# EasyEDA Pro project M0G3507拓展.eprj, board PCB1
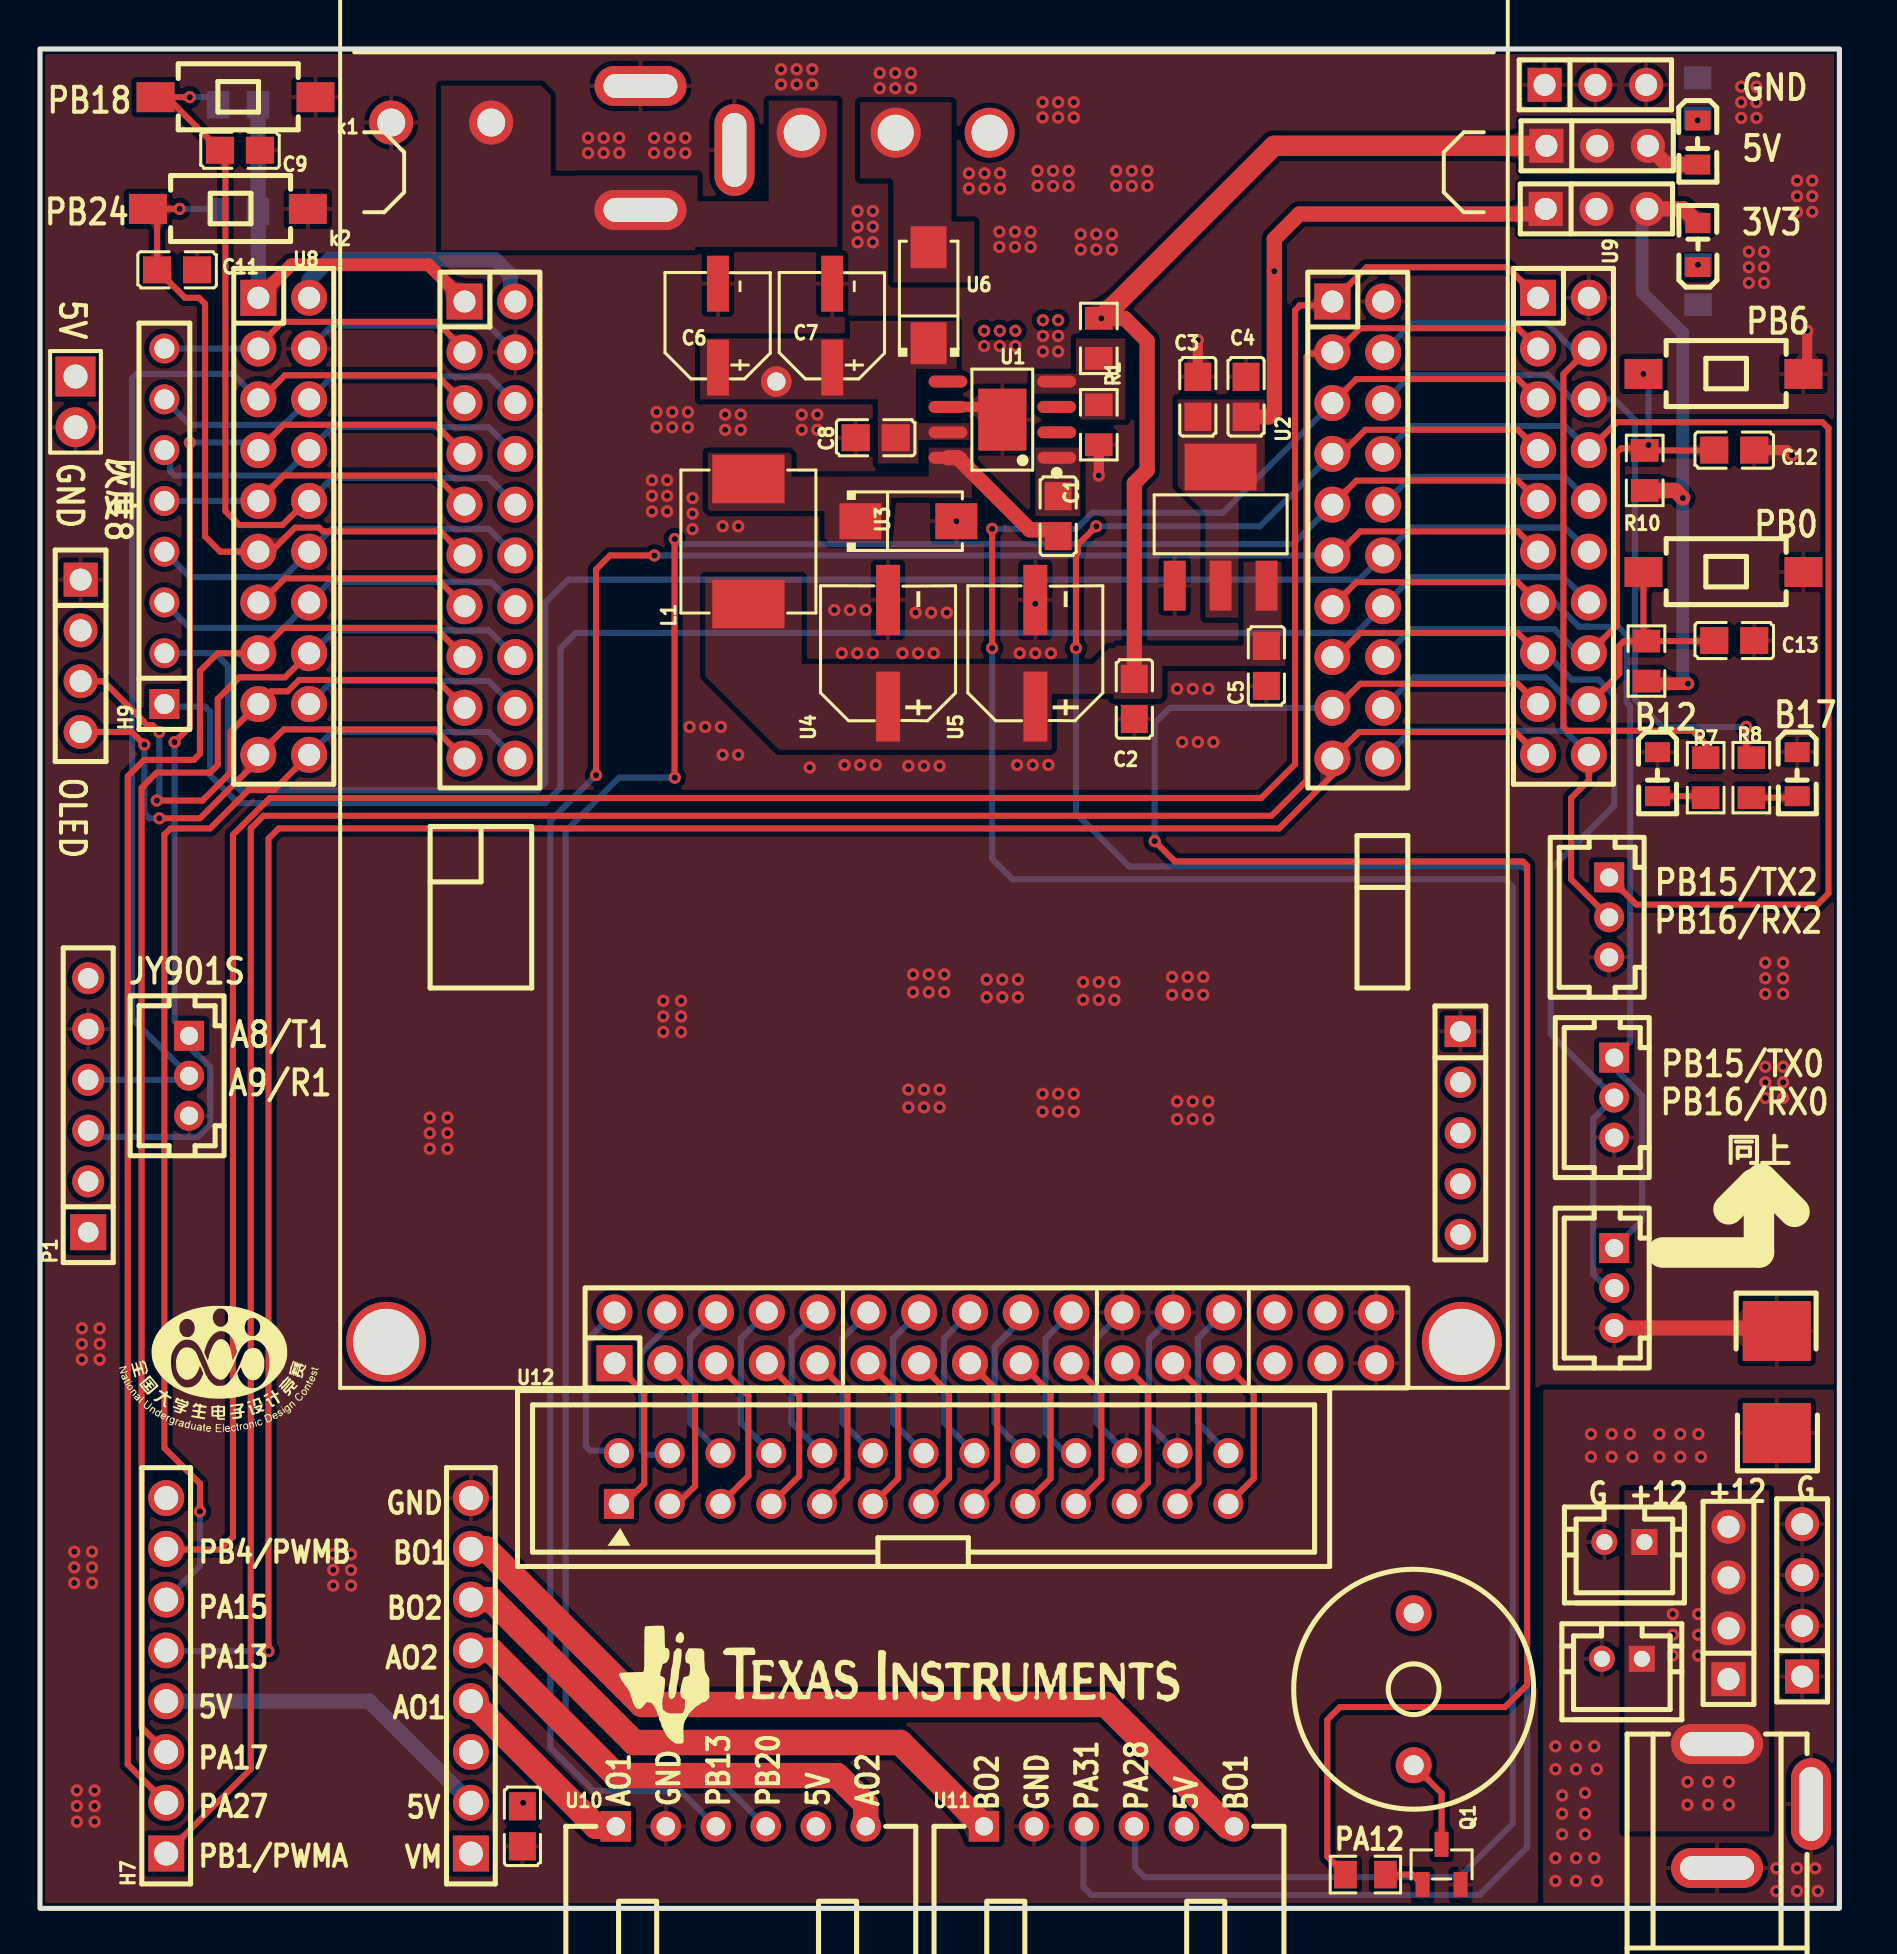
[diagram p1: board, top side]
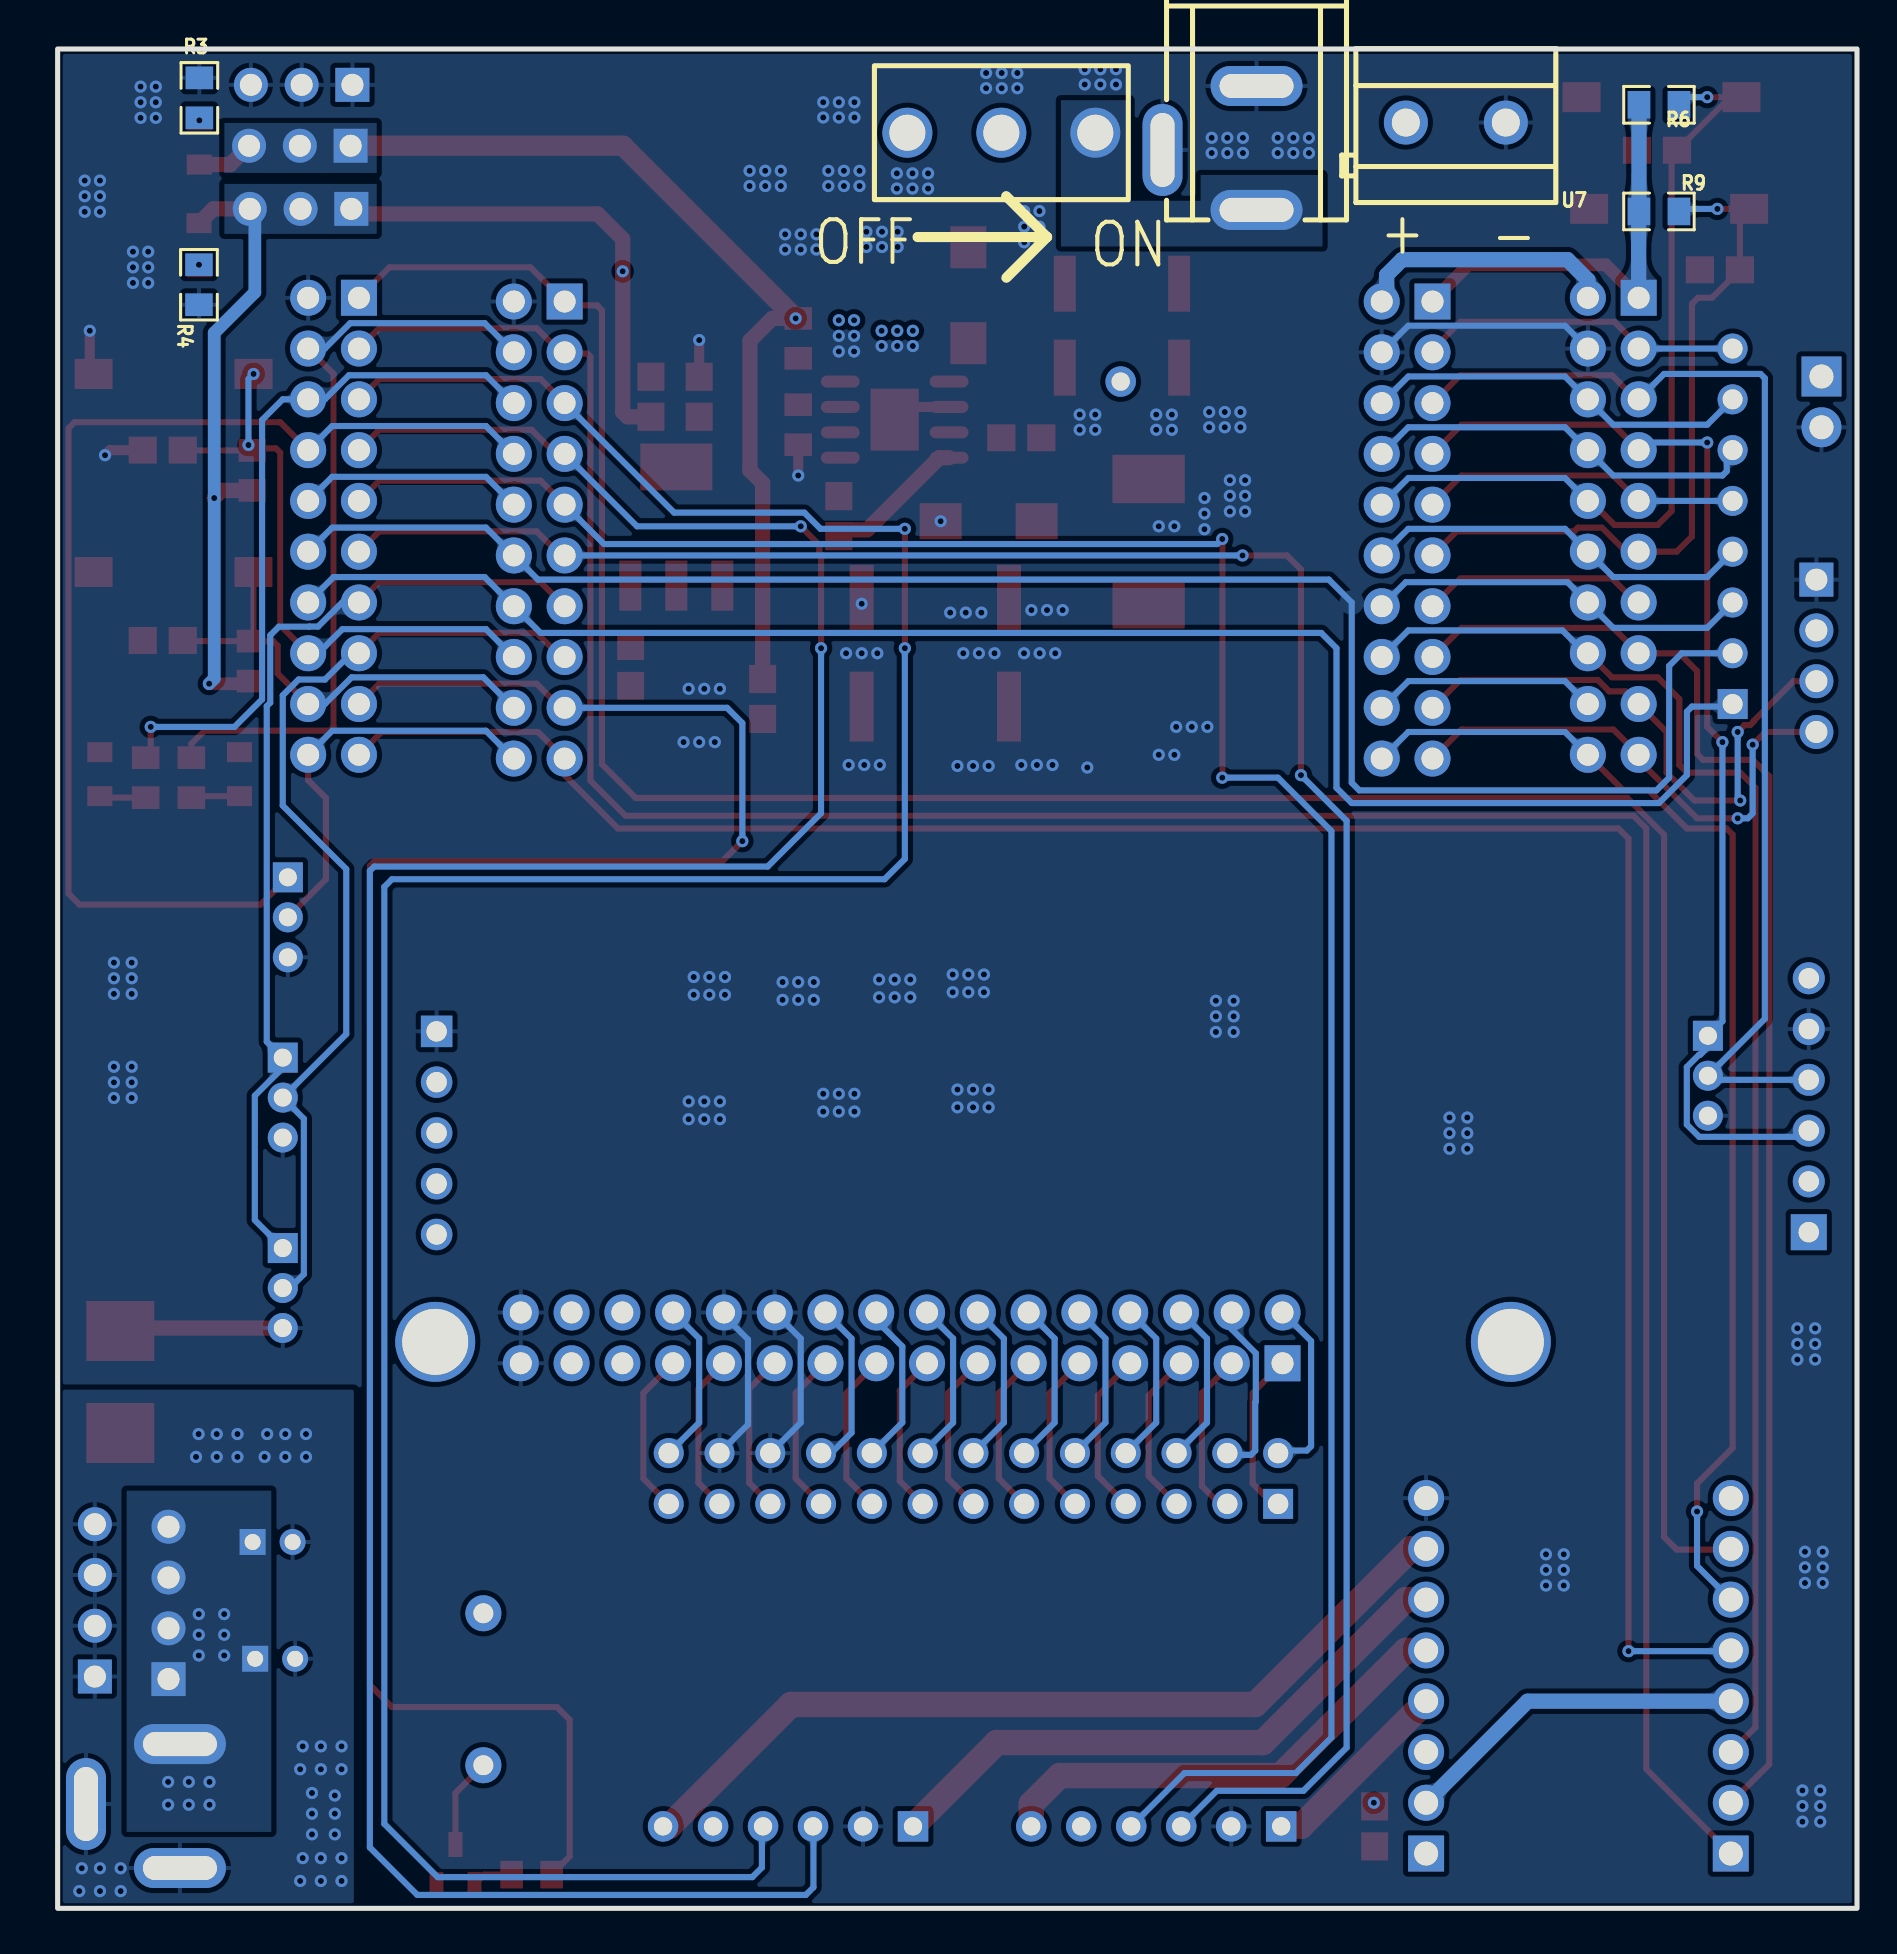
[diagram p2: board, bottom side, seen from below]

Outline 90 x 93 mm; copper layers: Top Layer, GND, 内层2, Bottom Layer. Coordinates in mm from the lower left corner of the outline.
Outline path: rectangle 0,93 90,0
Stack: Top Layer 0.035mm 外层铜厚1oz / Dielectric1 0.2104mm 7628 RC49% 8.6mil / GND 0.0152mm 内层铜厚 / Dielectric2 1.065mm 1.1mm H/HOZ Copper / 内层2 0.0152mm 内层铜厚 / Dielectric3 0.2104mm 7628 RC49% 8.6mil / Bottom Layer 0.035mm 外层铜厚1oz

## Design rules (mm)
template: JLCPCB Capability(Two Layers Board)
spacing copperThickness1oz (default): track to track 0.102, other pairs 0.152 to 0.3
spacing copperThickness2oz: track to track 0.203, other pairs 0.152 to 0.3
track width copperThickness1oz (default): min 0.127, default 0.254, max 2.54
track width copperThickness2oz: min 0.203, default 0.254, max 2.54
differential pair differentialPair (default): width min 0.127, default 0.254, max 2.54; gap min 0.152, default 0.152
via viaSize (default): diameter min 0.5, default 0.61, max 10; hole min 0.3, default 0.305, max 6.3

## Placement (name value [footprint] x y rotation side)
BUZZER1  2.3kHz  [BUZ-TH_BD12.0-P7.60-D0.6-FD]  68.71 10.96 270 top
C1  10nF  [C0805]  50.93 69.63 90 top
C2  100nF  [C0805]  54.74 60.49 90 top
C3  100nF  [C0805]  57.91 75.6 270 top
C4  10uF  [C0805]  60.32 75.6 270 top
C5  100nF  [C0805]  61.34 62.14 90 top
C6  4.7uF  [CAP-SMD_BD5.0-L5.3-W5.3-FD]  33.91 79.16 90 top
C7  4.7uF  [CAP-SMD_BD5.0-L5.3-W5.3-FD]  39.62 79.16 90 top
C8  100nF  [C0805]  41.8 73.55 180 top
C9  100nF  [C0805]  10 87.93 180 top
C10  100nF  [C0805]  24.13 4.1 270 top
C11  100nF  [C0805]  6.86 81.95 180 top
C12  100nF  [C0805]  84.74 72.93 180 top
C13  100nF  [C0805]  84.74 63.41 180 top
CN1  WAFER-PH2.0-2PZZ-H62  [CONN-TH_2P-P2.00_WAFER-PH2.0-2PZZ-H62]  79.12 12.48 180 top
CN2  WAFER-PH2.0-2PZZ-H62  [CONN-TH_2P-P2.00_WAFER-PH2.0-2PZZ-H62]  79.25 18.32 180 top
DC1  -  [DC-005_2.5]  84.2 4.99 270 top
DC1#2  -  [DC-005_2.5]  30.35 88.17 90 bottom
H1  PZ254V-11-03P  [HDR-TH_3P-P2.54-V-M]  77.8 91.2 0 top
H2  PZ254V-11-03P  [HDR-TH_3P-P2.54-V-M]  77.89 88.16 0 top
H3  PZ254V-11-03P  [HDR-TH_3P-P2.54-V-M]  77.85 85 0 top
H4  PZ254V-11-04P  [HDR-TH_4P-P2.54-V-M]  88.14 15.4 90 top
H5  PZ254V-11-04P  [HDR-TH_4P-P2.54-V-M]  84.46 15.28 90 top
H6  -  [HDR-TH_8P-P2.54-V-F-1]  21.55 11.63 90 top
H7  TB6612  [HDR-TH_8P-P2.54-V-F-1]  6.31 11.63 90 top
H8  OLED  [HDR-TH_4P-P2.54-V-F]  2.03 62.65 270 top
H9  PZ254V-11-08P  [HDR-TH_8P-P2.54-V-M]  6.22 69.12 90 top
H10  PZ254V-11-02P  [HDR-TH_2P-P2.54-V-M]  1.78 75.35 270 top
k1  TS-1101-C-W  [SW-SMD_L6.0-W3.3-LS8.0]  9.78 90.59 180 top
k2  TS-1101-C-W  [SW-SMD_L6.0-W3.3-LS8.0]  9.4 85 180 top
k3  TS-1101-C-W  [SW-SMD_L6.0-W3.3-LS8.0]  84.2 76.74 180 top
k4  TS-1101-C-W  [SW-SMD_L6.0-W3.3-LS8.0]  84.2 66.84 180 top
L1  15uH  [IND-SMD_L7.0-W6.6_FXL0630]  35.43 68.36 90 top
LED1  -  [LED_0805]  82.91 88.27 270 top
LED2  -  [LED_0805]  82.93 83.24 90 top
LED3  -  [LED_0805]  80.9 56.68 270 top
LED4  -  [LED_0805]  87.88 56.68 270 top
NOREF  -  [Pad_e2930]  36.83 76.36 0 top
P1  2.54-1*6P母  [HDR-TH_6P-P2.54-V-F]  2.41 40.17 90 top
Q1  SS8050  [SOT-23-3_L2.9-W1.3-P1.90-LS2.4-BR]  70.1 2.19 270 top
R1  3.16kΩ  [R0805]  52.96 74.2 270 top
R2  10K  [R0805]  52.96 78.52 270 top
R3  2K  [R0805]  82.91 90.55 270 bottom
R4  510  [R0805]  82.93 81.2 90 bottom
R5  0Ω  [RES-SMD_L6.4-W3.2-A]  86.87 26.32 90 top
R6  10K  [R0805]  9.91 90.21 0 bottom
R7  1K  [R0805]  83.31 56.55 90 top
R8  1K  [R0805]  85.6 56.55 90 top
R9  10K  [R0805]  9.91 84.87 0 bottom
R10  10K  [R0805]  80.26 71.92 270 top
R11  10K  [R0805]  80.35 62.38 270 top
R12  1k  [R0805]  66.29 1.69 0 top
SW1  SS-12D10L5  [SW-TH_SS-12D10L5]  42.8 88.81 0 bottom
U1  TPS5450QDDARQ1  [SOIC-8_L4.9-W3.9-P1.27-LS6.0-BL-EP]  48.13 74.46 90 top
U2  AMS1117-3.3  [SOT-223-3_L6.5-W3.4-P2.30-LS7.0-BR]  59.06 69.12 270 top
U3  SS54  [SMA_L4.2-W2.6-LS5.1-RD]  43.43 69.38 0 top
U4  100uF  [CAP-SMD_BD6.3-L6.6-W6.6-LS7.3-FD]  42.42 62.77 90 top
U5  100uF  [CAP-SMD_BD6.3-L6.6-W6.6-LS7.3-FD]  49.78 62.77 90 top
U6  SS54  [SMA_L4.2-W2.6-LS5.1-RD]  44.45 80.68 90 top
U7  KF301-5.0-2P  [CONN-TH_P5.00_KF301-5.0-2P]  20.07 89.32 0 bottom
U8  PM254-2-10-Z-8.5  [HDR-TH_20P-P2.54-V-F-R2-C10-S2.54]  12.19 69.12 270 top
U9  PM254-2-10-Z-8.5  [HDR-TH_20P-P2.54-V-F-R2-C10-S2.54]  76.2 69.12 270 top
U10  BX-XH2.54-6PWZ  [CONN-TH_6P-P2.50_BX-XH2.54-6PWZ]  35.05 4.1 0 top
U11  BX-XH2.54-6PWZ  [CONN-TH_6P-P2.50_BX-XH2.54-6PWZ]  53.47 4.1 0 top
U12  ZX-IDC2.54-2-13PZZ  [IDC-TH_26P-P2.54_ZX-IDC2.54-2-13PZZ]  44.2 21.5 0 top
U13  XY-PH2.0-3A11  [HDR-TH_3P-P2.00-V-F-4]  78.49 49.57 270 top
U14  XY-PH2.0-3A11  [HDR-TH_3P-P2.00-V-F-4]  7.46 41.64 270 top
U15  XY-PH2.0-3A11  [HDR-TH_3P-P2.00-V-F-4]  78.74 40.55 270 top
U16  XY-PH2.0-3A11  [HDR-TH_3P-P2.00-V-F-4]  78.74 31.02 270 top
U99  TL  [LP_M0G3507_L107.0_W58.5]  44.21 92.83 0 top

## Footprints (pads in the part's own frame, mm; a bottom-side part is the same pattern mirrored in y, then rotated)
BUZ-TH_BD12.0-P7.60-D0.6-FD
  round 1.8 hole 1: 1(-3.8,0) 2(3.8,0)
C0805
  rect 1.41x1.35 smd: 1(-1,0) 2(1,0)
CAP-SMD_BD5.0-L5.3-W5.3-FD
  rect 2.8x1.1 smd: 1(-2.1,0) 2(2.1,0)
CAP-SMD_BD6.3-L6.6-W6.6-LS7.3-FD
  rect 3.5x1.2 smd: 1(-2.67,0) 2(2.67,0)
CONN-TH_2P-P2.00_WAFER-PH2.0-2PZZ-H62
  rect 1.3x1.3 hole 0.8: 1(-1,0)
  round 1.3 hole 0.8: 2(1,0)
CONN-TH_6P-P2.50_BX-XH2.54-6PWZ
  rect 1.524x1.524 hole 0.914: 1(-6.25,0)
  round 1.524 hole 0.914: 2(-3.75,0) 3(-1.25,0) 4(1.25,0) 5(3.75,0) 6(6.25,0)
CONN-TH_P5.00_KF301-5.0-2P
  round 2.2 hole 1.4: 1(-2.5,0) 2(2.5,0)
DC-005_2.5
  oval 2x4.6 hole 1.2x3.7: 1(-3.227,-0.318) 2(2.973,-0.318)
  oval 4.6x2 hole 3.7x1.2: 3(-0.227,4.382)
HDR-TH_2P-P2.54-V-M
  rect 2x2 hole 1.2: 1(-1.27,0)
  round 2 hole 1.2: 2(1.27,0)
HDR-TH_3P-P2.00-V-F-4
  rect 1.5x1.5 hole 0.9: 1(-2,0)
  round 1.5 hole 0.9: 2(0,0) 3(2,0)
HDR-TH_3P-P2.54-V-M
  rect 1.7x1.7 hole 1.1: 1(-2.54,0)
  round 1.7 hole 1.1: 2(0,0) 3(2.54,0)
HDR-TH_4P-P2.54-V-F
  rect 1.7x1.7 hole 1.1: 1(-3.81,0)
  round 1.7 hole 1.1: 2(-1.27,0) 3(1.27,0) 4(3.81,0)
HDR-TH_4P-P2.54-V-M
  rect 1.7x1.7 hole 1.1: 1(-3.81,0)
  round 1.7 hole 1.1: 2(-1.27,0) 3(1.27,0) 4(3.81,0)
HDR-TH_6P-P2.54-V-F
  rect 1.8x1.8 hole 1.02: 1(-6.35,0)
  round 1.6 hole 1.02: 2(-3.81,0) 3(-1.27,0) 4(1.27,0) 5(3.81,0) 6(6.35,0)
HDR-TH_8P-P2.54-V-F-1
  rect 1.8x1.8 hole 1.2: 1(-8.89,0)
  round 1.8 hole 1.2: 2(-6.35,0) 3(-3.81,0) 4(-1.27,0) 5(1.27,0) 6(3.81,0) 7(6.35,0) 8(8.89,0)
HDR-TH_8P-P2.54-V-M
  rect 1.5x1.5 hole 1: 1(-8.89,0)
  round 1.5 hole 1: 2(-6.35,0) 3(-3.81,0) 4(-1.27,0) 5(1.27,0) 6(3.81,0) 7(6.35,0) 8(8.89,0)
HDR-TH_20P-P2.54-V-F-R2-C10-S2.54
  rect 1.8x1.8 hole 1.1: 1(-11.43,-1.27)
  round 1.8 hole 1.1: 2(-11.43,1.27) 3(-8.89,-1.27) 4(-8.89,1.27) 5(-6.35,-1.27) 6(-6.35,1.27) 7(-3.81,-1.27) 8(-3.81,1.27) 9(-1.27,-1.27) 10(-1.27,1.27) 11(1.27,-1.27) 12(1.27,1.27) 13(3.81,-1.27) 14(3.81,1.27) 15(6.35,-1.27) 16(6.35,1.27) 17(8.89,-1.27) 18(8.89,1.27) 19(11.43,-1.27) 20(11.43,1.27)
IDC-TH_26P-P2.54_ZX-IDC2.54-2-13PZZ
  rect 1.5x1.5 hole 1.02: 1(-15.24,-1.27)
  round 1.5 hole 1.02: 2(-15.24,1.27) 3(-12.7,-1.27) 4(-12.7,1.27) 5(-10.16,-1.27) 6(-10.16,1.27) 7(-7.62,-1.27) 8(-7.62,1.27) 9(-5.08,-1.27) 10(-5.08,1.27) 11(-2.54,-1.27) 12(-2.54,1.27) 13(0,-1.27) 14(0,1.27) 15(2.54,-1.27) 16(2.54,1.27) 17(5.08,-1.27) 18(5.08,1.27) 19(7.62,-1.27) 20(7.62,1.27) 21(10.16,-1.27) 22(10.16,1.27) 23(12.7,-1.27) 24(12.7,1.27) 25(15.24,-1.27) 26(15.24,1.27)
IND-SMD_L7.0-W6.6_FXL0630
  rect 2.424x3.62 smd: 1(3.128,0) 2(-3.128,0)
LED_0805
  rect 1x1.25 smd: 1(-1.15,0.005) 2(1.05,0.005)
LP_M0G3507_L107.0_W58.5
  rect 1.8x1.8 hole 1.1: 1(-22.981,-12.466) 21(20.428,-12.466) 41(-15.48,-65.57)
  round 1.8 hole 1.1: 2(-22.981,-15.007) 3(-22.981,-17.547) 4(-22.981,-20.087) 5(-22.981,-22.627) 6(-22.981,-25.166) 7(-22.981,-27.706) 8(-22.981,-30.247) 9(-22.981,-32.786) 10(-22.981,-35.327) 11(-20.441,-35.327) 12(-20.441,-32.786) 13(-20.441,-30.247) 14(-20.441,-27.706) 15(-20.441,-25.166) 16(-20.441,-22.627) 17(-20.441,-20.087) 18(-20.441,-17.547) 19(-20.441,-15.007) 20(-20.441,-12.466) 22(20.428,-15.007) 23(20.428,-17.547) 24(20.428,-20.087) 25(20.428,-22.627) 26(20.428,-25.166) 27(20.428,-27.706) 28(20.428,-30.247) 29(20.428,-32.786) 30(20.428,-35.327) 31(22.968,-35.327) 32(22.968,-32.786) 33(22.968,-30.247) 34(22.968,-27.706) 35(22.968,-25.166) 36(22.968,-22.627) 37(22.968,-20.087) 38(22.968,-17.547) 39(22.968,-15.007) 40(22.968,-12.466) 42(-12.94,-65.57) 43(-10.4,-65.57) 44(-7.86,-65.57) 45(-5.32,-65.57) 46(-5.32,-63.03) 47(-7.86,-63.03) 48(-10.4,-63.03) 49(-12.94,-63.03) 50(-15.48,-63.03) 51(-2.78,-65.57) 52(-0.24,-65.57) 53(2.3,-65.57) 54(4.84,-65.57) 55(7.38,-65.57) 56(7.38,-63.03) 57(4.84,-63.03) 58(2.3,-63.03) 59(-0.24,-63.03) 60(-2.78,-63.03) 61(9.92,-65.57) 62(12.46,-65.57) 63(15,-65.57) 64(15,-63.03) 65(12.46,-63.03) 66(9.92,-63.03) 67(17.54,-65.57) 68(20.08,-65.57) 69(22.62,-65.57) 70(22.62,-63.03) 71(20.08,-63.03) 72(17.54,-63.03)
  rect 1.575x1.575 hole 1.02: 73(26.83,-48.97)
  round 1.575 hole 1.02: 74(26.83,-51.51) 75(26.83,-54.05) 76(26.83,-56.59) 77(26.83,-59.13)
  round 4 hole 3.3: 78(-26.9,-64.5) 79(26.9,-64.5)
Pad_e2930
  round 1.524 hole 0.914: 1(0,0)
R0805
  rect 1.133x1.377 smd: 1(-1,0) 2(1,0)
RES-SMD_L6.4-W3.2-A
  rect 3x3.4 smd: 1(-2.55,0) 2(2.55,0)
SMA_L4.2-W2.6-LS5.1-RD
  rect 2.1x1.8 smd: 1(-2.4,0) 2(2.4,0)
SOIC-8_L4.9-W3.9-P1.27-LS6.0-BL-EP
  oval 0.602x1.941 smd: 1(-1.905,-2.72) 2(-0.635,-2.72) 3(0.635,-2.72) 4(1.905,-2.72) 5(1.905,2.72) 6(0.635,2.72) 7(-0.635,2.72) 8(-1.905,2.72)
  rect 3.098x2.41 smd: 9(0,0)
SOT-23-3_L2.9-W1.3-P1.90-LS2.4-BR
  rect 1.25x0.7 smd: 1(1,-0.95) 2(1,0.95) 3(-1,0)
SOT-223-3_L6.5-W3.4-P2.30-LS7.0-BR
  rect 2.5x1.1 smd: 1(2.97,-2.3) 2(2.97,0) 3(2.97,2.3)
  rect 2.34x3.6 smd: 4(-2.97,0)
SW-SMD_L6.0-W3.3-LS8.0
  rect 1.9x1.5 smd: 1(-4,0) 2(4,0)
SW-TH_SS-12D10L5
  round 2.5 hole 1.8: 1(-4.7,0) 2(0,0) 3(4.7,0)

## Nets
3V3: C3.2 C4.2 H3.1 H3.2 H3.3 H8.2 LED2.2 P1.2 R6.2 R9.2 R10.2 R11.2 U2.2 U2.4 U8.1 U99.1 U99.68 U99.71
5V: BUZZER1.1 C2.2 C5.2 C10.1 H2.1 H2.2 H2.3 H6.2 H7.4 H10.1 L1.2 LED1.2 R2.1 U2.3 U4.1 U5.1 U8.2 U10.5 U11.5 U99.20 U99.67 U99.72
12V: DC1#2.1 SW1.1 U7.2
12V_BAT: CN1.1 CN2.1 DC1.1 H5.1 H5.2 H5.3 H5.4
+12V: SW1.2 U6.2
GND: C2.1 C3.1 C4.1 C5.1 C6.2 C7.2 C8.2 C9.1 C10.2 C11.1 C12.1 C13.1 DC1#2.2 DC1#2.3 H1.1 H1.2 H1.3 H6.8 H8.1 H10.2 k1.1 k2.1 k3.1 k4.1 LED3.1 LED4.1 P1.5 Q1.2 R1.2 R3.1 R4.1 R5.2 U1.6 U1.9 U2.1 U3.2 U4.2 U5.2 U7.1 U8.4 U9.2 U10.2 U11.2 U12.22 U12.24 U13.3 U14.3 U15.3 U16.3 U99.19 U99.40 U99.65 U99.66 U99.69 U99.70 U99.73
GND_BAT: CN1.2 CN2.2 DC1.2 DC1.3 H4.1 H4.2 H4.3 H4.4 R5.1
A12: U12.21 U99.61
A13: U12.23 U99.62
AO1: H6.4 U10.1
AO2: H6.5 U10.6
BO1: H6.7 U11.6
BO2: H6.6 U11.1
EC11_A: U99.76
EC11_B: U99.77
EC11_K: U99.75
NRST: U9.10 U99.36
PA0: U12.2 U99.50
PA1: U12.12 U99.60
PA2: U12.20 U99.56
PA3: U12.19 U99.55
PA4: U12.18 U99.57
PA5: U12.17 U99.54
PA6: U12.16 U99.58
PA7: U12.15 U99.53
PA8/T1: P1.3 U8.7 U14.1 U99.4
PA9/R1: P1.4 U8.5 U14.2 U99.3
PA10: U12.25 U99.63
PA10/T0: U9.13 U15.1 U16.1 U99.27
PA11: U12.26 U99.64
PA11/R0: U9.15 U15.2 U16.2 U99.28
PA12: R12.1 U9.17 U99.29
PA13: H7.5 U9.19 U99.30
PA14: U12.14 U99.59
PA15: H7.6 U8.20 U99.11
PA17: H7.3 U8.16 U99.13
PA18: H9.4 U8.12 U99.15
PA21: U12.13 U99.52
PA22: H9.6 U8.8 U99.17
PA23: U12.11 U99.51
PA24: H9.3 U8.14 U99.14
PA25: H9.8 U8.3 U99.2
PA26: H9.5 U8.9 U99.5
PA27: H7.2 U8.15 U99.8
PA28: U9.5 U11.4 U99.23
PA31: U9.7 U11.3 U99.24
PB0: C13.2 k4.2 R11.1 U9.18 U99.32
PB1_PWMA: H7.1 U9.3 U99.22
PB2_SCL1: H8.3 U8.17 U99.9
PB3_SDA1: H8.4 U8.19 U99.10
PB4_PWMB: H7.7 U9.1 U99.21
PB5: U12.10 U99.46
PB6: C12.2 k3.2 R10.1 U9.16 U99.33
PB7: H9.1 U9.14 U99.34
PB8: H9.2 U9.12 U99.35
PB9: U8.13 U99.7
PB10: U12.9 U99.45
PB11: U12.8 U99.47
PB12: R7.2 U9.4 U99.39
PB13: U9.11 U10.3 U99.26
PB15/T2: U9.8 U13.1 U99.37
PB16/R2: U9.20 U13.2 U99.31
PB17: R8.2 U9.6 U99.38
PB18: C9.2 k1.2 R6.1 U8.10 U99.16
PB19: H9.7 U8.6 U99.18
PB20: U9.9 U10.4 U99.25
PB21: U12.7 U99.44
PB22: U12.6 U99.48
PB23: U12.5 U99.43
PB24: C11.2 k2.2 R9.1 U8.11 U99.6
PB25: U12.4 U99.49
PB26: U12.3 U99.42
PB27: U12.1 U99.41
SW2: U8.18 U99.12
$1N2343: C6.1 C7.1 C8.1 H6.1 NOREF.1 U1.7 U6.1
$1N2346: C1.1 L1.1 U1.8 U3.1
$1N2347: C1.2 U1.1
$1N2351: R1.1 R2.2 U1.4
$1N2353: LED1.1 R3.2
$1N2356: LED2.1 R4.2
$1N4593: LED3.2 R7.1
$1N4596: LED4.2 R8.1
$1N4743: Q1.1 R12.2
$1N4744: BUZZER1.2 Q1.3
$1N34298: U99.74

Pads without a net: H6 3; H7 8; P1 1 6; SW1 3; U1 2 3 5; U99 78 79

## Via types
v1: diameter 0.61, hole 0.305, Top Layer to Bottom Layer, 330 vias

## Routing (per net, layer and track width the routed paths; a pad name or vN(x,y) marks a point on that pad's centre or on a via; arc(x,y) is an arc through that point)
3V3: length 228.6
  Top Layer w0.635: R11.2 80.49,61.25 v1(82.42,61.25) ; U8.1 12.57,82.2 19.43,82.2 21.23,80.4 U99.1
  Top Layer w0.762: R10.2 81.79,70.92 v1(82.17,70.54) ; H3.1 75.06,84.75 62.99,84.75 61.74,83.49 v1(61.74,81.88) 61.74,74.84 61.5,74.6 C4.2 ; 82.93,84.29 82.21,85 H3.3
  内层2 w0.762: U99.1 22.75,81.88 v1(61.74,81.88) ; P1.2 3.75,37.69 3.75,47.07 3.56,47.26 3.56,62.27 2.03,63.79 H8.2 4.32,66.2 4.32,80.3 4.57,80.55 U8.1 ; U99.71 U99.68 64.29,25.4 64.64,25.06 79.25,25.06 82.42,28.23 v1(82.42,61.25)
  Bottom Layer w0.635: H3.3 80.14,84.75 80.14,80.83 82.17,78.79 v1(82.17,70.54) 82.17,61.5 v1(82.42,61.25)
  Bottom Layer w0.762: U8.1 10.92,84.86 R9.2 R6.2
5V: length 256.7
  Top Layer w0.762: C2.2 54.74,71.28 55.37,71.92 55.37,78.4 54.25,79.52 v1(53.09,79.52) ; LED1.2 81.37,87.22 H2.3
  Top Layer w1.016: v1(53.09,79.52) 61.72,88.16 H2.1
  内层2 w0.762: U8.2 12.36,81.66 12.36,81.67 12.04,81.99 12.03,81.99 10.67,83.35 2.41,83.35 2.1,83.03 2.1,76.93 H10.1 ; H6.2 v1(24.17,5.28) 24.89,6 36.9,6 U10.5 41.09,1.81 56.77,1.81 57.31,2.35 57.31,3.81 57.28,3.85 ; U99.20 24.62,79.52 v1(53.09,79.52) 53.85,78.76 53.85,58.08 63.12,48.8 63.12,30.65 62.86,30.4 62.86,29.89 62.52,29.55 62.01,29.55 U99.72 U99.67 62.94,26.08 62.94,24.85 68.71,19.09 BUZZER1.1 59.34,5.4 59.18,5.4 58.42,4.64 58.42,4.47 58.05,4.1 U11.5
  Bottom Layer w0.762: H6.2 16.47,10.36 H7.4 ; U8.2 13.46,81.44 14.48,82.46 22.76,82.46 23.53,81.69 23.53,80.61 U99.20
  vias: v1(47.22,78.9) v1(48.01,78.9) v1(48.79,78.9) v1(50.16,79.43) v1(50.93,79.43)
12V_BAT:
  vias: v1(81.67,14.72) v1(81.67,13.68) v1(81.67,12.65) v1(82.4,6.32) v1(82.4,5.18) v1(82.94,14.72) v1(82.94,13.68) v1(82.94,12.65) v1(83.44,6.32) v1(83.44,5.18) v1(84.47,6.32) v1(84.47,5.18)
GND: length 45.7
  Top Layer w0.508: C12.1 87.38,72.93 v1(87.63,72.68) ; v1(88.39,78.9) 88.39,76.94 k3.1 ; C3.1 v1(57.91,78.44) ; U1.6 47.5,75.09 47.63,74.96 ; R1.2 v1(52.96,71.66)
  Top Layer w0.762: U16.3 86.72,29.02 86.87,28.88
  Bottom Layer w0.305: U99.66 52.83,28.5 52.83,24.29 U12.22 ; U12.24 55.47,24.19 55.47,28.45 56.67,29.66 U99.65 ; U8.4 14.61,79.16 22.44,79.16 U99.19
  vias: v1(1.71,17.84) v1(1.71,17.05) v1(1.71,16.27) v1(1.84,5.9) v1(1.84,5.12) v1(1.84,4.34) v1(2.1,29.01) v1(2.1,28.23) v1(2.1,27.45) v1(2.6,17.84) v1(2.6,17.05) v1(2.6,16.27) v1(2.73,5.9) v1(2.73,5.12) v1(2.73,4.34) v1(2.98,29.01) v1(2.98,28.23) v1(2.98,27.45) v1(14.67,17.71) v1(14.67,16.93) v1(14.67,16.15) v1(15.56,17.71) v1(15.56,16.93) v1(15.56,16.15) v1(19.49,39.55) v1(19.49,38.77) v1(19.49,37.99) v1(20.38,39.55) v1(20.38,38.77) v1(20.38,37.99) v1(27.41,88.56) v1(27.41,87.79) v1(28.19,88.56) v1(28.19,87.79) v1(28.97,88.56) v1(28.97,87.79) v1(30.61,71.43) v1(30.61,70.65) v1(30.61,69.87) v1(30.72,88.56) v1(30.72,87.79) v1(30.84,74.84) v1(30.84,74.08) v1(31.18,45.39) v1(31.18,44.61) v1(31.18,43.83) v1(31.37,71.43) v1(31.37,70.65) v1(31.37,69.87) v1(31.5,88.56) v1(31.5,87.79) v1(31.62,74.84) v1(31.62,74.08) v1(32.07,45.39) v1(32.07,44.61) v1(32.07,43.83) v1(32.28,88.56) v1(32.28,87.79) v1(32.4,74.84) v1(32.4,74.08) v1(32.49,59.09) v1(32.64,70.54) v1(32.64,69.76) v1(32.64,68.98) v1(33.27,59.09) v1(34.14,69.12) v1(34.06,59.09) v1(34.14,57.69) v1(34.27,74.71) v1(34.27,73.95) v1(34.93,69.12) v1(34.93,57.69) v1(35.05,74.71) v1(35.05,73.95) v1(37.06,91.98) v1(37.06,91.22) v1(37.85,91.98) v1(37.85,91.22) v1(38.1,74.71) v1(38.1,73.95) v1(38.5,57.06) v1(38.63,91.98) v1(38.63,91.22) v1(38.88,74.71) v1(38.88,73.95) v1(39.73,64.93) v1(40.1,62.77) v1(40.24,57.19) v1(40.51,64.93) v1(40.89,84.89) v1(40.89,84.11) v1(40.89,83.33) v1(40.88,62.77) v1(41.02,57.19) v1(41.29,64.93) v1(41.66,84.89) v1(41.66,84.11) v1(41.66,83.33) v1(41.66,62.77) v1(41.8,57.19) v1(42,91.8) v1(42,91.03) v1(42.78,91.8) v1(42.78,91.03) v1(43.14,62.77) v1(43.43,57.14) v1(43.43,40.95) v1(43.43,40.06) v1(43.56,91.8) v1(43.56,91.03) v1(43.67,46.71) v1(43.67,45.82) v1(43.8,64.81) v1(43.92,62.77) v1(44.21,57.14) v1(44.21,40.95) v1(44.21,40.06) v1(44.45,46.71) v1(44.45,45.82) v1(44.58,64.81) v1(44.7,62.77) v1(45,57.14) v1(45,40.95) v1(45,40.06) v1(45.23,46.71) v1(45.23,45.82) v1(45.36,64.81) v1(45.83,69.38) v1(46.46,86.78) v1(46.46,86.02) v1(47.24,86.78) v1(47.24,86.02) v1(47.22,78.14) v1(47.35,46.45) v1(47.35,45.57) v1(48.03,86.78) v1(48.03,86.02) v1(47.99,83.86) v1(47.99,83.09) v1(48.01,78.14) v1(48.13,46.45) v1(48.13,45.57) v1(48.77,83.86) v1(48.77,83.09) v1(48.79,78.14) v1(48.88,57.19) v1(48.91,46.45) v1(48.91,45.57) v1(49,62.77) v1(49.55,83.86) v1(49.55,83.09) v1(49.66,57.19) v1(49.78,65.25) v1(49.78,62.77) v1(49.89,86.9) v1(49.89,86.14) v1(50.15,90.33) v1(50.15,89.57) v1(50.15,40.74) v1(50.15,39.85) v1(50.16,78.65) v1(50.16,77.87) v1(50.44,57.19) v1(50.56,62.77) v1(50.67,86.9) v1(50.67,86.14) v1(50.93,90.33) v1(50.93,89.57) v1(50.93,78.65) v1(50.93,77.87) v1(50.93,40.74) v1(50.93,39.85) v1(51.45,86.9) v1(51.45,86.14) v1(51.71,90.33) v1(51.71,89.57) v1(51.71,40.74) v1(51.71,39.85) v1(52.05,83.73) v1(52.05,82.97) v1(52.18,46.33) v1(52.18,45.44) v1(52.83,83.73) v1(52.83,82.97) v1(52.96,46.33) v1(52.96,45.44) v1(53.61,83.73) v1(53.61,82.97) v1(53.74,46.33) v1(53.74,45.44) v1(53.83,86.9) v1(53.83,86.14) v1(54.61,86.9) v1(54.61,86.14) v1(55.39,86.9) v1(55.39,86.14) v1(56.62,46.58) v1(56.62,45.69) v1(56.88,61) v1(56.88,40.36) v1(56.88,39.47) v1(57.13,58.33) v1(57.4,46.58) v1(57.4,45.69) v1(57.66,61) v1(57.66,40.36) v1(57.66,39.47) v1(57.91,58.33) v1(58.19,46.58) v1(58.19,45.69) v1(58.44,61) v1(58.44,40.36) v1(58.44,39.47) v1(58.69,58.33) v1(85.09,91.11) v1(85.09,90.33) v1(85.09,89.55) v1(85.47,82.86) v1(85.47,82.08) v1(85.47,81.3) v1(85.85,91.11) v1(85.85,90.33) v1(85.85,89.55) v1(86.23,82.86) v1(86.23,82.08) v1(86.23,81.3) v1(86.3,47.3) v1(86.3,46.52) v1(86.3,45.74) v1(86.3,42.09) v1(86.3,41.31) v1(86.3,40.53) v1(87.19,47.3) v1(87.19,46.52) v1(87.19,45.74) v1(87.19,42.09) v1(87.19,41.31) v1(87.19,40.53) v1(87.88,86.42) v1(87.88,85.63) v1(87.88,84.85) v1(88.65,86.42) v1(88.65,85.63) v1(88.65,84.85)
GND_BAT:
  vias: v1(75.8,8.1) v1(75.8,6.96) v1(75.8,2.51) v1(75.8,1.37) v1(76.14,5.64) v1(76.14,4.74) v1(76.14,3.7) v1(76.84,8.1) v1(76.84,6.96) v1(76.84,2.51) v1(76.84,1.37) v1(77.28,5.77) v1(77.28,4.74) v1(77.28,3.7) v1(77.58,23.72) v1(77.58,22.58) v1(77.74,8.1) v1(77.74,2.51) v1(77.87,6.96) v1(77.87,1.37) v1(78.61,23.72) v1(78.61,22.58) v1(79.52,23.72) v1(79.65,22.58) v1(81.01,23.72) v1(81.01,22.58) v1(82.04,23.72) v1(82.04,22.58) v1(82.95,23.72) v1(83.08,22.58) v1(86.85,2) v1(86.85,0.86) v1(87.88,2) v1(87.88,0.86) v1(88.79,2) v1(88.92,0.86)
A12: length 8
  Top Layer w0.305: U12.21 55.41,21.28 55.41,25.99 U99.61
A13: length 8
  Top Layer w0.305: U12.23 57.95,21.28 57.95,25.99 U99.62
AO1: length 9.8
  Top Layer w1.27: H6.4 27.81,4.1 U10.1
AO2: length 24
  Top Layer w1.27: H6.5 22.57,12.9 28.83,6.64 39.88,6.64 41.3,5.22 U10.6
BO1: length 43.9
  Top Layer w1.27: H6.7 22.31,17.98 30.1,10.2 53.31,10.2 59.41,4.1 U11.6
BO2: length 30.4
  Top Layer w1.27: H6.6 22.57,15.44 29.72,8.29 43.03,8.29 U11.1
NRST: length 11.4
  Bottom Layer w0.305: U99.36 68.58,71.6 76.27,71.6 U9.10
PA0: length 9.1
  Bottom Layer w0.305: U12.2 28.83,22.9 27.52,22.9 27.31,23.11 27.31,28.37 U99.50
PA1: length 8.2
  Bottom Layer w0.305: U99.60 40.13,28.5 40.13,24.29 U12.12
PA2: length 8.5
  Bottom Layer w0.305: U99.56 50.29,28.5 50.29,23.78 51.31,22.77 U12.20
PA3: length 8.2
  Top Layer w0.305: U99.55 53.09,25.77 53.09,21.5 U12.19
PA4: length 8.2
  Bottom Layer w0.305: U99.57 49.05,29.41 47.75,28.1 47.75,24.29 U12.18
PA5: length 8.2
  Top Layer w0.305: U12.17 50.55,21.5 50.55,25.77 U99.54
PA6: length 8.2
  Bottom Layer w0.305: U12.16 45.21,24.29 45.21,28.5 U99.58
PA7: length 8.1
  Top Layer w0.305: U99.53 47.88,25.9 47.88,21.37 U12.15
PA8/T1: length 56.7
  Top Layer w0.305: U99.4 19.78,74.2 12.19,74.2 U8.7 ; v1(7.49,73.31) 7.49,59.09 v1(6.73,58.33)
  Bottom Layer w0.305: v1(7.49,73.31) 10.54,73.31 U8.7 ; P1.3 2.72,38.59 7.89,38.59 8.51,39.21 8.51,42.08 7.89,42.7 7.84,42.7 7.46,43.08 U14.1 6.73,44.37 v1(6.73,58.33)
PA9/R1: length 59.5
  Top Layer w0.305: U99.3 19.84,76.68 12.25,76.68 11.05,75.47 U8.5
  Bottom Layer w0.305: P1.4 7.25,41.44 U14.2 4.61,44.49 4.61,76.53 4.83,76.74 9.65,76.74 U8.5
PA10: length 8.2
  Top Layer w0.305: U12.25 60.71,21.5 60.71,25.77 U99.63
PA10/T0: length 48.5
  Top Layer w0.305: U9.13 73.91,66.33 65.85,66.33 U99.27
  Bottom Layer w0.305: U16.1 80.14,34.42 80.14,40.64 78.74,42.04 U15.1 79.54,43.35 79.54,60.13 79.37,60.3 79.37,63.67 78.94,64.1 77.41,64.1 77.4,64.11 76.97,64.11 75.77,65.31 U9.13
PA11: length 8.2
  Bottom Layer w0.305: U12.26 57.91,24.29 57.91,28.5 U99.64
PA11/R0: length 49.4
  Top Layer w0.305: U99.28 64.84,62.59 66.04,63.79 73.91,63.79 U9.15
  Bottom Layer w0.305: U16.2 78.74,30.93 78.48,30.93 77.69,31.72 77.69,39.49 U15.2 75.56,43.72 75.56,51.98 78.74,55.15 78.74,60.67 77.95,61.46 76.63,61.46 75.31,62.77 U9.15
PA12: length 105.3
  Top Layer w0.305: R12.1 64.39,2.59 64.39,9.43 65.02,10.07 73.28,10.07 74.38,11.17 74.38,52.14 74.17,52.36 56.77,52.36 v1(55.75,53.38) ; U99.29 64.84,60.05 66.04,61.25 73.91,61.25 U9.17
  Bottom Layer w0.305: U99.29 56.51,60.05 55.75,59.28 v1(55.75,53.38)
PA13: length 112.4
  Top Layer w0.305: U9.19 73.79,58.84 65.97,58.84 U99.30 64.64,56.68 61.98,54.01 11.94,54.01 11.43,53.5 v1(11.43,12.86)
  Bottom Layer w0.305: H7.5 6.35,12.86 v1(11.43,12.86)
PA14: length 8.2
  Bottom Layer w0.305: U12.14 42.67,24.29 42.67,28.5 U99.59
PA15: length 59.9
  Top Layer w0.305: v1(8,19.85) 8,21.25 6.22,23.02 6.22,53.71 6.53,54.01 8.51,54.01 10.44,55.94 11.71,55.94 U8.20
  Bottom Layer w0.305: U99.11 22.44,58.84 14.61,58.84 U8.20 ; v1(8,19.85) 8,17.13 H7.6
PA17: length 73.2
  Top Layer w0.305: H7.3 5.08,9.05 5.08,56.04 5.84,56.81 8.51,56.81 8.89,57.19 8.89,60.49 9.97,61.57 12.26,61.57 U8.16
  Bottom Layer w0.305: U8.16 13.59,62.77 14.73,63.92 22.44,63.92 U99.13
PA18: length 19.6
  Bottom Layer w0.305: H9.4 7.49,66.58 12.19,66.58 U8.12 14.61,69 22.44,69 U99.15
PA21: length 8.2
  Top Layer w0.305: U99.52 45.47,25.77 45.47,21.5 U12.13
PA22: length 20.1
  Bottom Layer w0.305: U99.17 22.44,74.08 14.61,74.08 U8.8 12.19,71.66 6.73,71.66 6.52,71.88 6.52,72.64 H9.6
PA23: length 8.2
  Top Layer w0.305: U99.51 42.93,25.77 42.93,21.5 U12.11
PA24: length 19.5
  Bottom Layer w0.305: U99.14 22.57,66.33 14.48,66.33 U8.14 12.19,64.04 7.49,64.04 H9.3
PA25: length 16.3
  Top Layer w0.305: U8.3 10.92,78.14 12.13,79.35 19.84,79.35 21.23,77.95 U99.2
  Bottom Layer w0.305: U8.3 H9.8
PA26: length 16.1
  Top Layer w0.305: U8.9 12.19,71.66 19.78,71.66 U99.5
  Bottom Layer w0.305: U8.9 H9.5
PA27: length 75.1
  Top Layer w0.305: U99.8 19.78,64.04 12.19,64.04 U8.15 8.89,62.77 8,61.89 8,57.75 7.7,57.44 5.21,57.44 4.39,56.62 4.39,7.2 H7.2
PA28: length 143.1
  Top Layer w0.305: U99.23 65.85,76.49 73.91,76.49 U9.5 ; v1(47.62,69) v1(47.62,63.03)
  Bottom Layer w0.305: v1(47.62,63.03) 47.62,52.49 48.64,51.47 73.28,51.47 73.66,51.09 73.66,4.23 70.99,1.56 55.25,1.56 54.78,2.04 54.78,4.04 U11.4 ; U99.23 59.16,69.81 52.65,69.81 51.84,69 v1(47.62,69)
PA31: length 138.3
  Top Layer w0.305: v1(52.83,69.12) 51.91,68.2 51.91,67.8 51.82,67.71 v1(51.82,63.03) ; U99.24 65.09,72.75 66.29,73.95 73.91,73.95 U9.7
  Bottom Layer w0.305: v1(52.83,69.12) 61.02,69.12 U99.24 ; U11.3 52.2,4.08 52.2,1.05 52.58,0.67 72.01,0.67 74.38,3.05 74.38,51.89 74.17,52.11 54.48,52.11 51.82,54.77 v1(51.82,63.03)
PB0: length 23.4
  Top Layer w0.305: k4.2 80.2,63.53 R11.1 ; R11.1 80.34,63.37 79.21,63.37 78.99,63.16 78.99,61.76 U9.18 ; R11.1 83.71,63.38 C13.2
  Bottom Layer w0.305: U99.32 68.71,61.57 75.3,61.57 76.63,60.23 U9.18
PB1_PWMA: length 140.6
  Top Layer w0.305: H7.1 10.54,6.97 10.54,54.01 11.18,54.65 61.59,54.65 63.35,56.4 63.35,77.61 63.5,77.76 64.58,77.76 U99.22 64.84,77.83 66.04,79.03 73.91,79.03 U9.3
PB2_SCL1: length 28.1
  Top Layer w0.305: U99.9 19.84,61.44 12.96,61.44 12.39,60.87 11.56,60.87 U8.17 9.53,58.84 9.53,56.81 8.13,55.41 v1(5.84,55.41) ; v1(5.97,58.84) 5.63,59.18 5.35,59.18 5.17,59.36 5.17,59.38 3.17,61.38 2.03,61.38
  Bottom Layer w0.305: v1(5.97,58.84) 5.97,55.53 v1(5.84,55.41)
PB3_SDA1: length 25.6
  Top Layer w0.305: v1(5.97,54.52) 8,54.52 10.92,57.44 U8.19 12.19,58.96 19.78,58.96 U99.10 ; v1(5.22,58.2) 4.58,58.84 H8.4
  Bottom Layer w0.305: v1(5.97,54.52) 5.46,54.52 5.22,54.76 v1(5.22,58.2)
PB4_PWMB: length 129.7
  Top Layer w0.305: U9.1 73.41,82.08 66.35,82.08 U99.21 64.45,80.17 62.99,80.17 62.99,80.13 62.78,79.92 62.78,57.22 61.09,55.53 11.49,55.53 9.65,53.7 9.65,18.58 9.02,17.94 6.35,17.94 H7.7
PB5: length 8.2
  Bottom Layer w0.305: U99.46 37.59,28.5 37.59,24.29 U12.10
PB6: length 30.9
  Top Layer w0.305: C12.2 83.72,72.92 R10.1 ; U9.16 78.87,64.17 78.87,72.81 79.08,73.02 80.29,73.02 v1(80.46,73.19)
  Bottom Layer w0.305: v1(80.2,76.74) 80.46,76.49 v1(80.46,73.19) ; U99.33 68.58,63.98 75.76,63.98 76.96,62.77 U9.16
PB7: length 84.5
  Bottom Layer w0.305: H9.1 6.35,60.11 8.25,60.11 8.51,59.85 8.51,56.68 9.91,55.28 25.27,55.28 26.03,56.04 26.03,63.03 26.8,63.79 65.85,63.79 U99.34 68.64,66.58 76.2,66.58 U9.14
PB8: length 88.6
  Bottom Layer w0.305: H9.2 8.76,62.77 9.4,62.14 9.4,56.55 10.03,55.92 24.89,55.92 25.27,56.3 25.27,65.31 26.42,66.46 65.97,66.46 U99.35 68.58,69.06 76.27,69.06 U9.12
PB9: length 11.4
  Top Layer w0.305: U8.13 11.05,65.31 12.25,66.52 19.84,66.52 U99.7
PB10: length 8.2
  Top Layer w0.305: U12.9 40.39,21.5 40.39,25.77 U99.45
PB11: length 8.2
  Bottom Layer w0.305: U99.47 35.05,28.5 35.05,24.29 U12.8
PB12: length 39
  Top Layer w0.305: U9.4 76.2,76.74 76.2,59.09 76.39,58.9 82.65,58.9 83.31,58.24 R7.2
  Bottom Layer w0.305: U9.4 76.63,78.01 75.36,79.28 68.64,79.28 U99.39
PB13: length 118.1
  Top Layer w0.305: U9.11 73.91,68.87 66.04,68.87 64.84,67.67 U99.26 ; v1(30.73,67.67) 28.51,67.67 27.81,66.97 v1(27.81,56.68)
  Bottom Layer w0.305: U99.26 v1(30.73,67.67) ; U10.3 32.02,5.88 27.69,5.88 25.53,8.04 25.53,54.39 v1(27.81,56.68)
PB15/T2: length 59.1
  Top Layer w0.305: U9.8 78.87,74.33 89.15,74.33 89.46,74.03 89.46,50.76 88.9,50.2 79.85,50.2 U13.1
  Bottom Layer w0.305: U9.8 76.27,74.14 68.58,74.14 U99.37
PB16/R2: length 20.6
  Top Layer w0.305: U9.20 77.47,56.42 76.58,55.53 76.58,51.47 U13.2
  Bottom Layer w0.305: U99.31 68.58,58.9 76.27,58.9 U9.20
PB17: length 35.9
  Top Layer w0.305: R8.2 85.34,57.81 v1(85.34,59.09)
  Bottom Layer w0.305: v1(85.34,59.09) 81.15,59.09 79.77,60.47 79.77,74.44 78.74,75.47 U9.6 76.63,75.47 75.43,76.68 68.58,76.68 U99.38
PB18: length 41.5
  Top Layer w0.305: 6.35,90.59 C9.2 9.27,87.66 9.27,69.89 9.97,69.19 12.13,69.19 13.33,70.39 U8.10 ; 6.35,90.59 v1(7.49,90.59) ; 6.35,90.59 k1.2
  Bottom Layer w0.305: v1(7.49,90.59) 8.53,90.59 R6.1 ; U8.10 14.61,71.54 22.44,71.54 U99.16
PB19: length 19.6
  Bottom Layer w0.305: U99.18 22.44,76.62 14.61,76.62 U8.6 12.19,74.2 7.49,74.2 H9.7
PB20: length 120.7
  Top Layer w0.305: U9.9 73.91,71.41 65.85,71.41 U99.25 ; v1(31.75,68.49) 31.74,68.48 31.74,56.56 v1(31.75,56.55)
  Bottom Layer w0.305: v1(31.75,68.49) 32,68.23 62.67,68.23 U99.25 ; v1(31.75,56.55) 28.96,56.55 26.29,53.88 26.29,8.55 28.07,6.77 33.63,6.77 U10.4
PB21: length 8.3
  Top Layer w0.305: U99.44 37.97,25.64 37.97,21.63 U12.7
PB22: length 8.2
  Bottom Layer w0.305: U99.48 32.51,28.5 32.51,24.29 U12.6
PB23: length 8.3
  Top Layer w0.305: U12.5 35.43,21.63 35.43,25.64 U99.43
PB24: length 36.1
  Top Layer w0.305: U99.6 20.03,68.87 14.15,68.87 13.96,69.06 12.76,69.06 11.37,67.66 11.11,67.66 U8.11 9.02,67.85 8.25,68.62 8.25,80.25 7.95,80.55 7.25,80.55 C11.2 5.86,84.54 k2.2 v1(6.98,85)
  Bottom Layer w0.305: v1(6.98,85) 8.78,85 R9.1
PB25: length 8.9
  Bottom Layer w0.305: U99.49 31.27,28.97 30.07,27.76 30.07,25.34 30.1,25.31 30.1,22.9 30.31,22.68 31.41,22.68 U12.4
PB26: length 8.4
  Top Layer w0.305: U12.3 31.88,20.23 32.77,21.12 32.77,25.77 U99.42
PB27: length 8.3
  Top Layer w0.305: U12.1 29.21,20.23 30.23,21.25 30.23,25.77 U99.41
SW2: length 11.3
  Bottom Layer w0.305: U99.12 22.44,61.38 14.61,61.38 U8.18
$1N2343: length 84.5
  内层2 w1.524: NOREF.1 36.83,41.56 18.54,23.28 18.54,2.83 19.08,2.29 21.1,2.29 H6.1
$1N2346: length 7.1
  Top Layer w0.762: U1.8 45.9,72.55 49.5,68.95 50.61,68.95 C1.1
$1N2353:
  vias: v1(82.91,89.43)
$1N2356:
  vias: v1(82.93,82.2)
$1N4593: length 2.4
  Top Layer w0.305: R7.1 83.24,55.63 LED3.2
$1N4596: length 2.3
  Top Layer w0.305: LED4.2 87.81,55.55 R8.1
$1N4743: length 2.1
  Top Layer w0.305: Q1.1 68.66,1.69 R12.2
$1N4744: length 4.5
  Top Layer w0.305: BUZZER1.2 70.1,5.76 Q1.3

## Copper pours and planes (outline as drawn; the poured copper is in the pictures)
3V3 on Top Layer: 74.04,86.25 81.66,86.25 81.66,83.75 74.04,83.75
3V3 on Top Layer: 56.9,75.47 61.26,75.47 61.26,64.55 56.9,64.55
3V3 on Bottom Layer: 74.04,86.25 81.66,86.25 81.66,83.75 74.04,83.75
5V on Top Layer: 74.08,89.41 81.7,89.41 81.7,86.91 74.08,86.91
5V on Top Layer: 53.7,67.35 62.29,67.35 62.29,60.49 53.7,60.49
5V on Top Layer: 33.27,66.58 55.98,66.58 55.98,57.95 33.27,57.95
5V on Bottom Layer: 74.04,89.3 81.66,89.3 81.66,86.8 74.04,86.8
12V on Top Layer: 26.8,90.41 39.88,90.41 39.88,83.09 26.8,83.09
12V on Top Layer: 20.07,91.16 32.77,91.16 32.77,82.97 20.07,82.97
12V on Top Layer: 20.07,91.13 32.77,91.13 32.77,82.93 20.07,82.93
12V on Bottom Layer: 26.73,90.43 39.81,90.43 39.81,83.12 26.73,83.12
12V_BAT on Top Layer: 79.25,20.91 86.49,20.91 86.49,3.85 79.25,3.85
12V_BAT on Bottom Layer: 79.31,20.89 86.55,20.89 86.55,3.82 79.31,3.82
+12V on Top Layer: 41.02,90.33 46.74,90.33 46.74,81.32 41.02,81.32
GND on Top Layer: -5.84,95.92 95.25,95.92 95.25,-6.44 -5.84,-6.44
GND on Bottom Layer: -5.46,97.19 94.23,97.19 94.23,-3.01 -5.46,-3.01
GND on GND: 0.26,92.74 89.74,92.74 89.74,0.26 0.26,0.26
GND_BAT on Top Layer: 75.18,25.94 90,25.94 90,0 75.18,0
GND_BAT on Bottom Layer: 75.18,25.94 90.3,25.94 90.3,0.04 75.18,0.04
$1N2343 on Top Layer: 33.02,79.4 46.48,79.4 46.48,72.27 33.02,72.27
$1N2346 on Top Layer: 33.4,73.06 46.61,73.06 46.61,68.28 33.4,68.28
$1N2347 on Top Layer: 49.78,73.06 52.04,73.06 52.04,69.63 49.78,69.63
$1N2351 on Top Layer: 49.65,78.52 54.29,78.52 54.29,74.46 49.65,74.46

Small or netless copper shapes (teardrops, artwork), in the pictures only: 158 on Top Layer, 136 on Bottom Layer, 103 on GND, 26 on 内层2

## Text on the board
Bottom Silkscreen Layer: - | + | ON | OFF
Top Silkscreen Layer: PA12 | G | +12 | AO1 | GND | PB13 | PB20 | 5V | AO2 | BO2 | PA31 | PA28 | BO1 | PB4/PWMB | PA15 | PA13 | PA17 | PA27 | PB1/PWMA | VM | PB24 | PB18 | 3V3 | PB6 | PB0 | B12 | B17 | A9/R1 | A8/T1 | PB16/RX2 | PB15/TX2 | PB16/RX0 | PB15/TX0 | OLED | JY901S | 同上 | 灰度8
